# EasyEDA Pro project ProPrj_国赛底层板子_2026-05-31.epro, schematic 国赛底板c
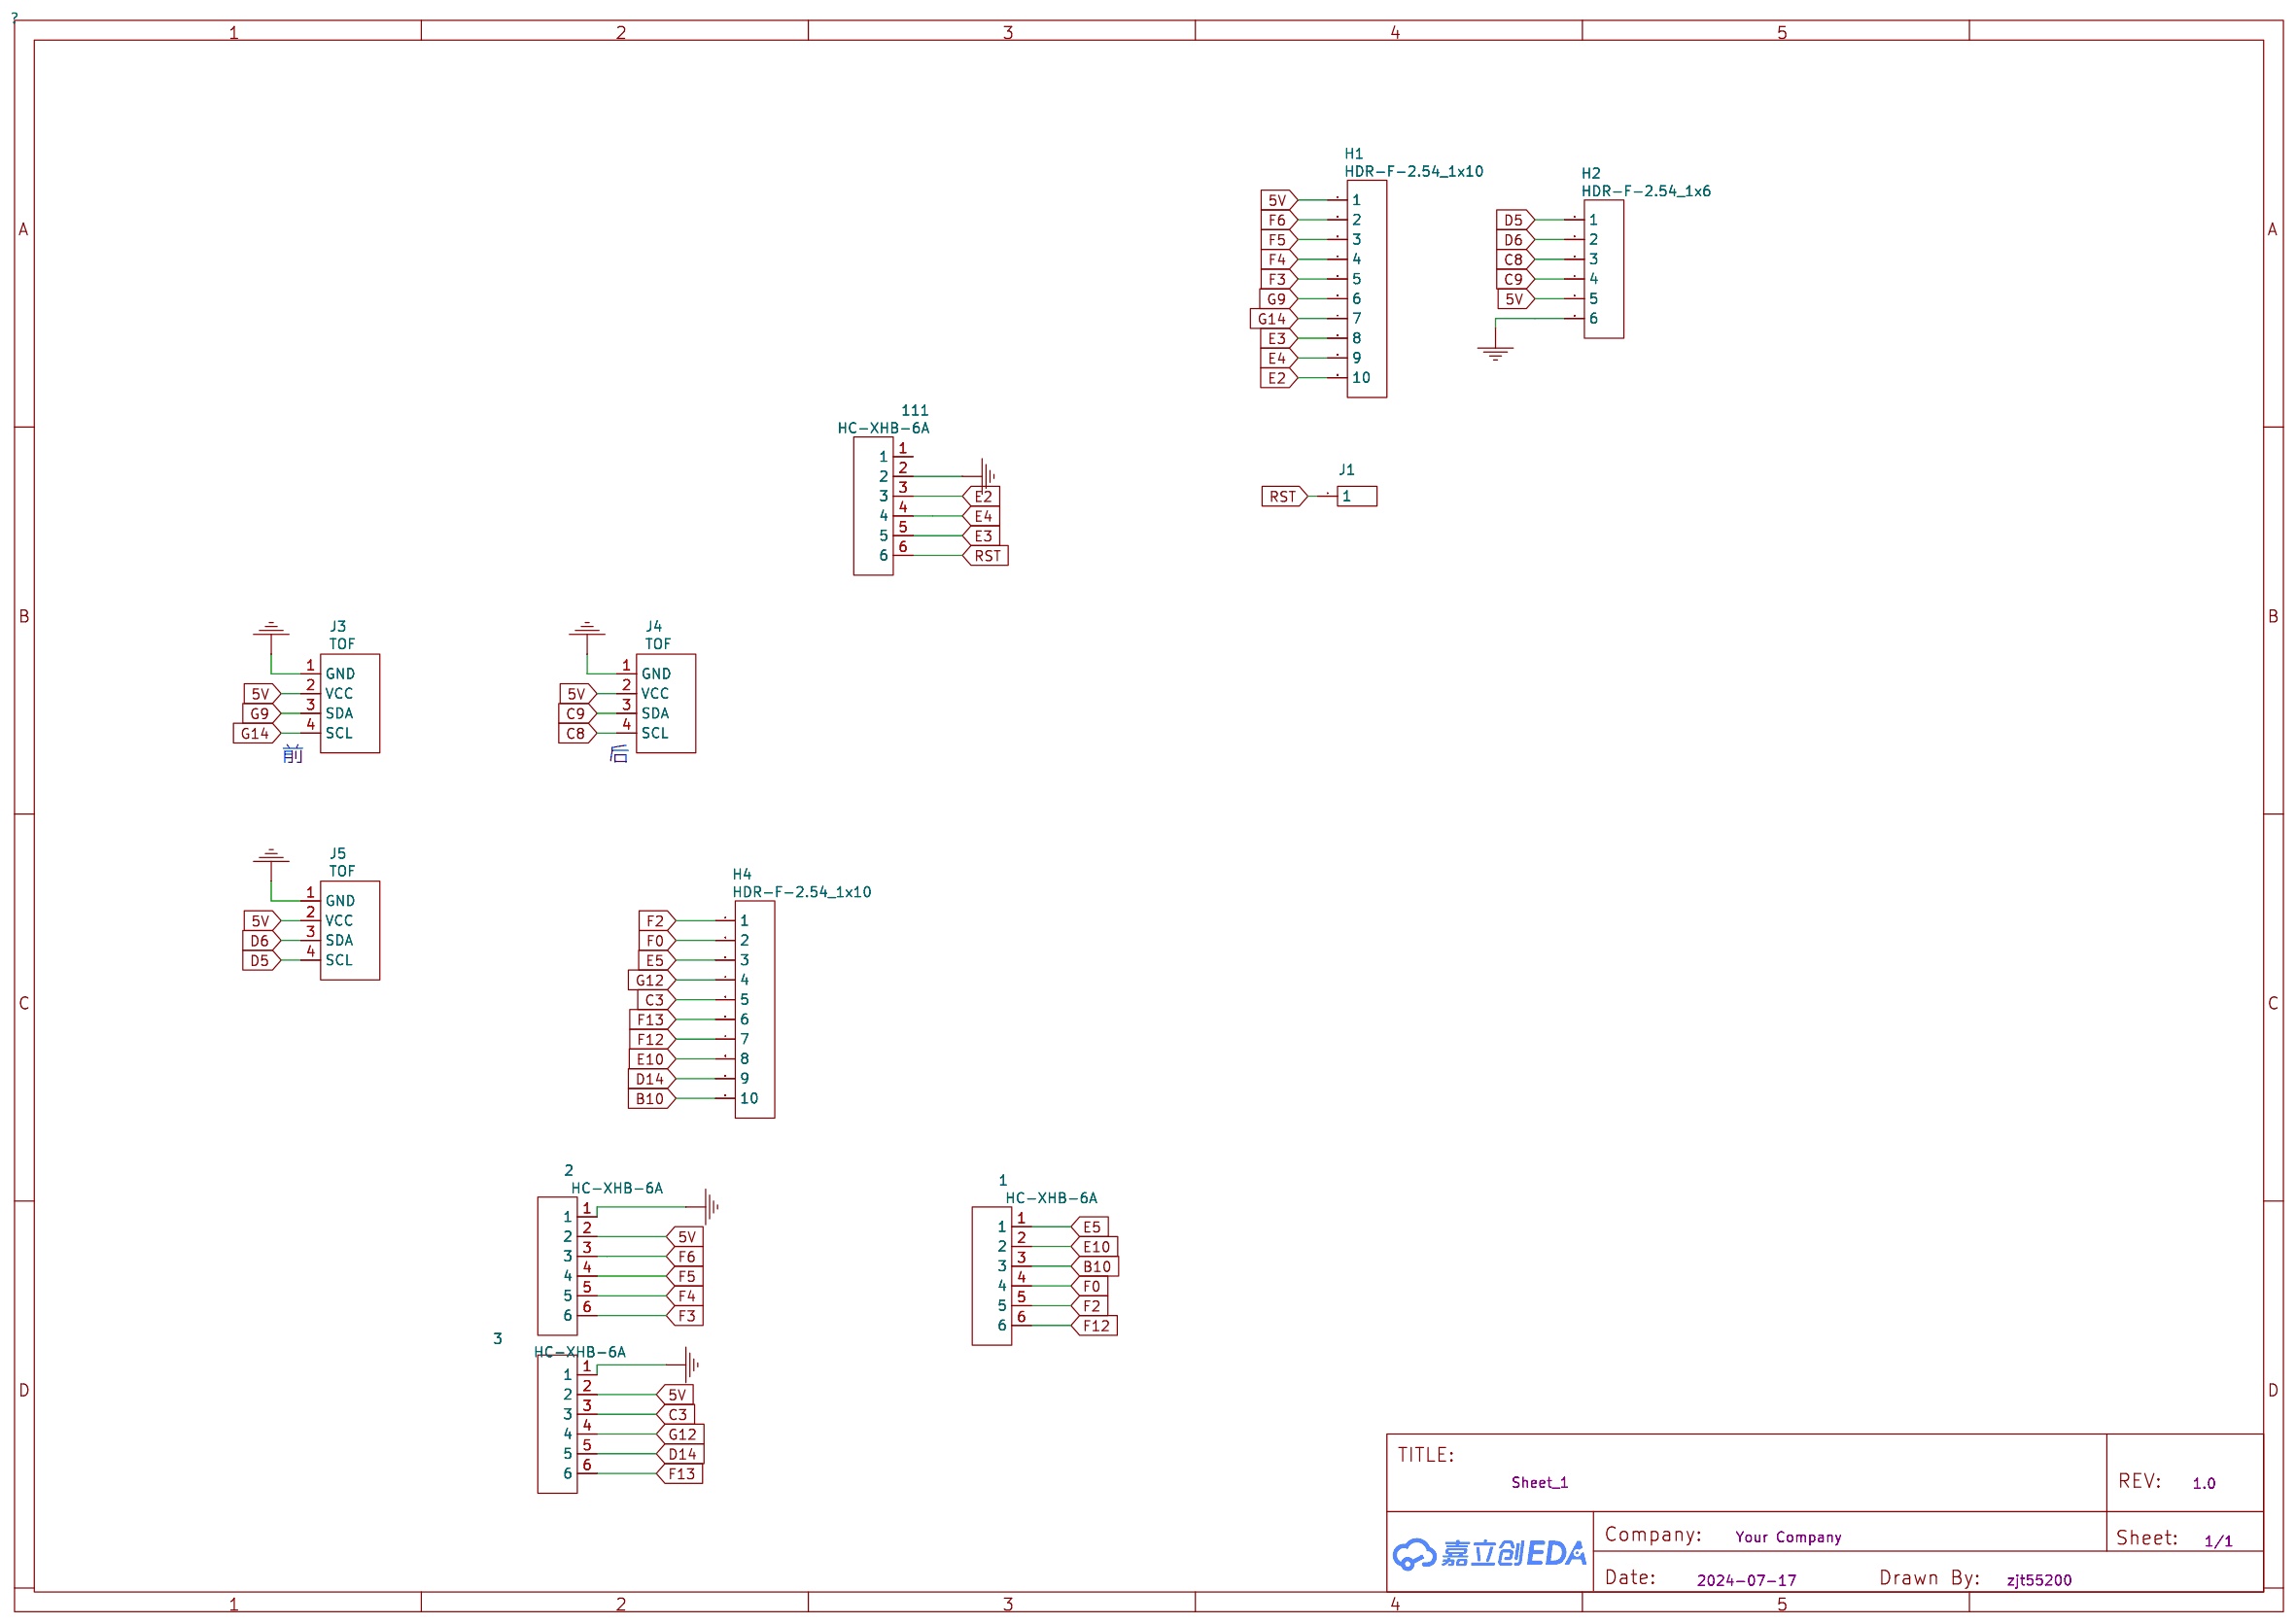
[diagram p4: schematic sheet]

## Parts
1  HC-XHB-6A  [CONN-TH_6P-P2.50_HCTL_HC-XHB-6A]
2  HC-XHB-6A  [CONN-TH_6P-P2.50_HCTL_HC-XHB-6A]
3  HC-XHB-6A  [CONN-TH_6P-P2.50_HCTL_HC-XHB-6A]
111  HC-XHB-6A  [CONN-TH_6P-P2.50_HCTL_HC-XHB-6A]
H1  HDR-F-2.54_1x10  [HDR-F-2.54_1X10]
H2  HDR-F-2.54_1x6  [HDR-F-2.54_1X6]
H4  HDR-F-2.54_1x10  [HDR-F-2.54_1X10]
J1  HDR-M-2.54_1x1  [HDR-M-2.54_1X1]
J3  TOF  [OLED10.96OLED]
J4  TOF  [OLED10.96OLED]
J5  TOF  [OLED10.96OLED]

## Library data of the parts
1-3 111 = HC-XHB-6A: Supplier: LCSC; Supplier Part: C2845494; Manufacturer: HCTL(华灿天禄); JLCPCB Part Class: Extended Part
H1 H4 = HDR-F-2.54_1x10: Supplier Part: C35445; Supplier: LCSC
H2 = HDR-F-2.54_1x6: Supplier Part: C40877; Supplier: LCSC
J1 = HDR-M-2.54_1x1: Supplier Part: C81276; Supplier: LCSC
J3-J5 = TOF

## Nets
5V: 2.2 3.2 H1.1 H2.5 J3.2(VCC) J4.2(VCC) J5.2(VCC)
GND: 2.1 3.1 111.2 H2.6 J3.1(GND) J4.1(GND) J5.1(GND)
B10: 1.3 H4.10
C3: 3.3 H4.5
C8: H2.3 J4.4(SCL)
C9: H2.4 J4.3(SDA)
D5: H2.1 J5.4(SCL)
D6: H2.2 J5.3(SDA)
D14: 3.5 H4.9
E2: 111.3 H1.10
E3: 111.5 H1.8
E4: 111.4 H1.9
E5: 1.1 H4.3
E10: 1.2 H4.8
F0: 1.4 H4.2
F2: 1.5 H4.1
F3: 2.6 H1.5
F4: 2.5 H1.4
F5: 2.4 H1.3
F6: 2.3 H1.2
F12: 1.6 H4.7
F13: 3.6 H4.6
G9: H1.6 J3.3(SDA)
G12: 3.4 H4.4
G14: H1.7 J3.4(SCL)
RST: 111.6 J1.1

Not connected (* = marked no-connect by the designer): 111 1

## Notes on the sheet
- 前
- 后
